# Altium schematic sheet EthIO_07_Storage.SchDoc
size A4; SheetNumber: 11; SheetTotal: 12
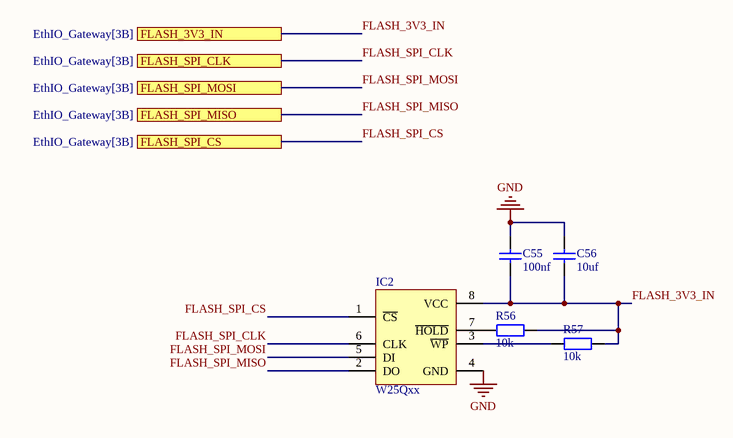
[diagram p0: EthIO_07_Storage.SchDoc]

## Parts
C55  100nf  [C0805_L]
C56  10uf  [C0805_L]
IC2  W25Qxx  [SOP8W_N]
R56  10k  [R0805_L]
R57  10k  [R0805_L]

## Ports
FLASH_3V3_IN (see EthIO_Gateway[3B]), FLASH_SPI_CLK (see EthIO_Gateway[3B]), FLASH_SPI_CS (see EthIO_Gateway[3B]), FLASH_SPI_MISO (see EthIO_Gateway[3B]), FLASH_SPI_MOSI (see EthIO_Gateway[3B])

## Nets
GND: C55.2 C56.2 IC2.4(GND)
FLASH_3V3_IN: C55.1 C56.1 IC2.8(VCC) R56.1 R57.1 ; port FLASH_3V3_IN
FLASH_SPI_CLK: IC2.6(CLK) ; port FLASH_SPI_CLK
FLASH_SPI_CS: IC2.1(~{CS}) ; port FLASH_SPI_CS
FLASH_SPI_MISO: IC2.2(DO) ; port FLASH_SPI_MISO
FLASH_SPI_MOSI: IC2.5(DI) ; port FLASH_SPI_MOSI
NetIC2_3: IC2.3(~{WP}) R57.2
NetIC2_7: IC2.7(~{HOLD}) R56.2

## Library data of the parts
C55 C56 = C: 贴片电容/MLCC电容; BOM名称: 无极性贴片电容; 当前库版本V2022.12.25 @淘宝卖家:黄晶宝石: 最新版本发布https://shop463601444.taobao.com
IC2 = W25Q: SPI Flash; BOM名称: 外置Flash; 封装库来自淘宝卖家：黄晶宝石: 其他店铺购入均为盗版封装库，无更新权益，退款现金奖励200~1000元; 当前库版本V2022.12.25 @淘宝卖家:黄晶宝石: 最新版本发布https://shop463601444.taobao.com
R56 R57 = R: 贴片电阻; 联系下单店铺卖家 免费帮你查找封装: 联系下单店铺卖家 免费技术支持; BOM名称: 贴片电阻